# Altium project John_Main.PrjPcb (part 2 of 3)

## Sheet Controller Section.SchDoc
size A3; DocumentNumber: 6; SheetNumber: 6; SheetTotal: 7
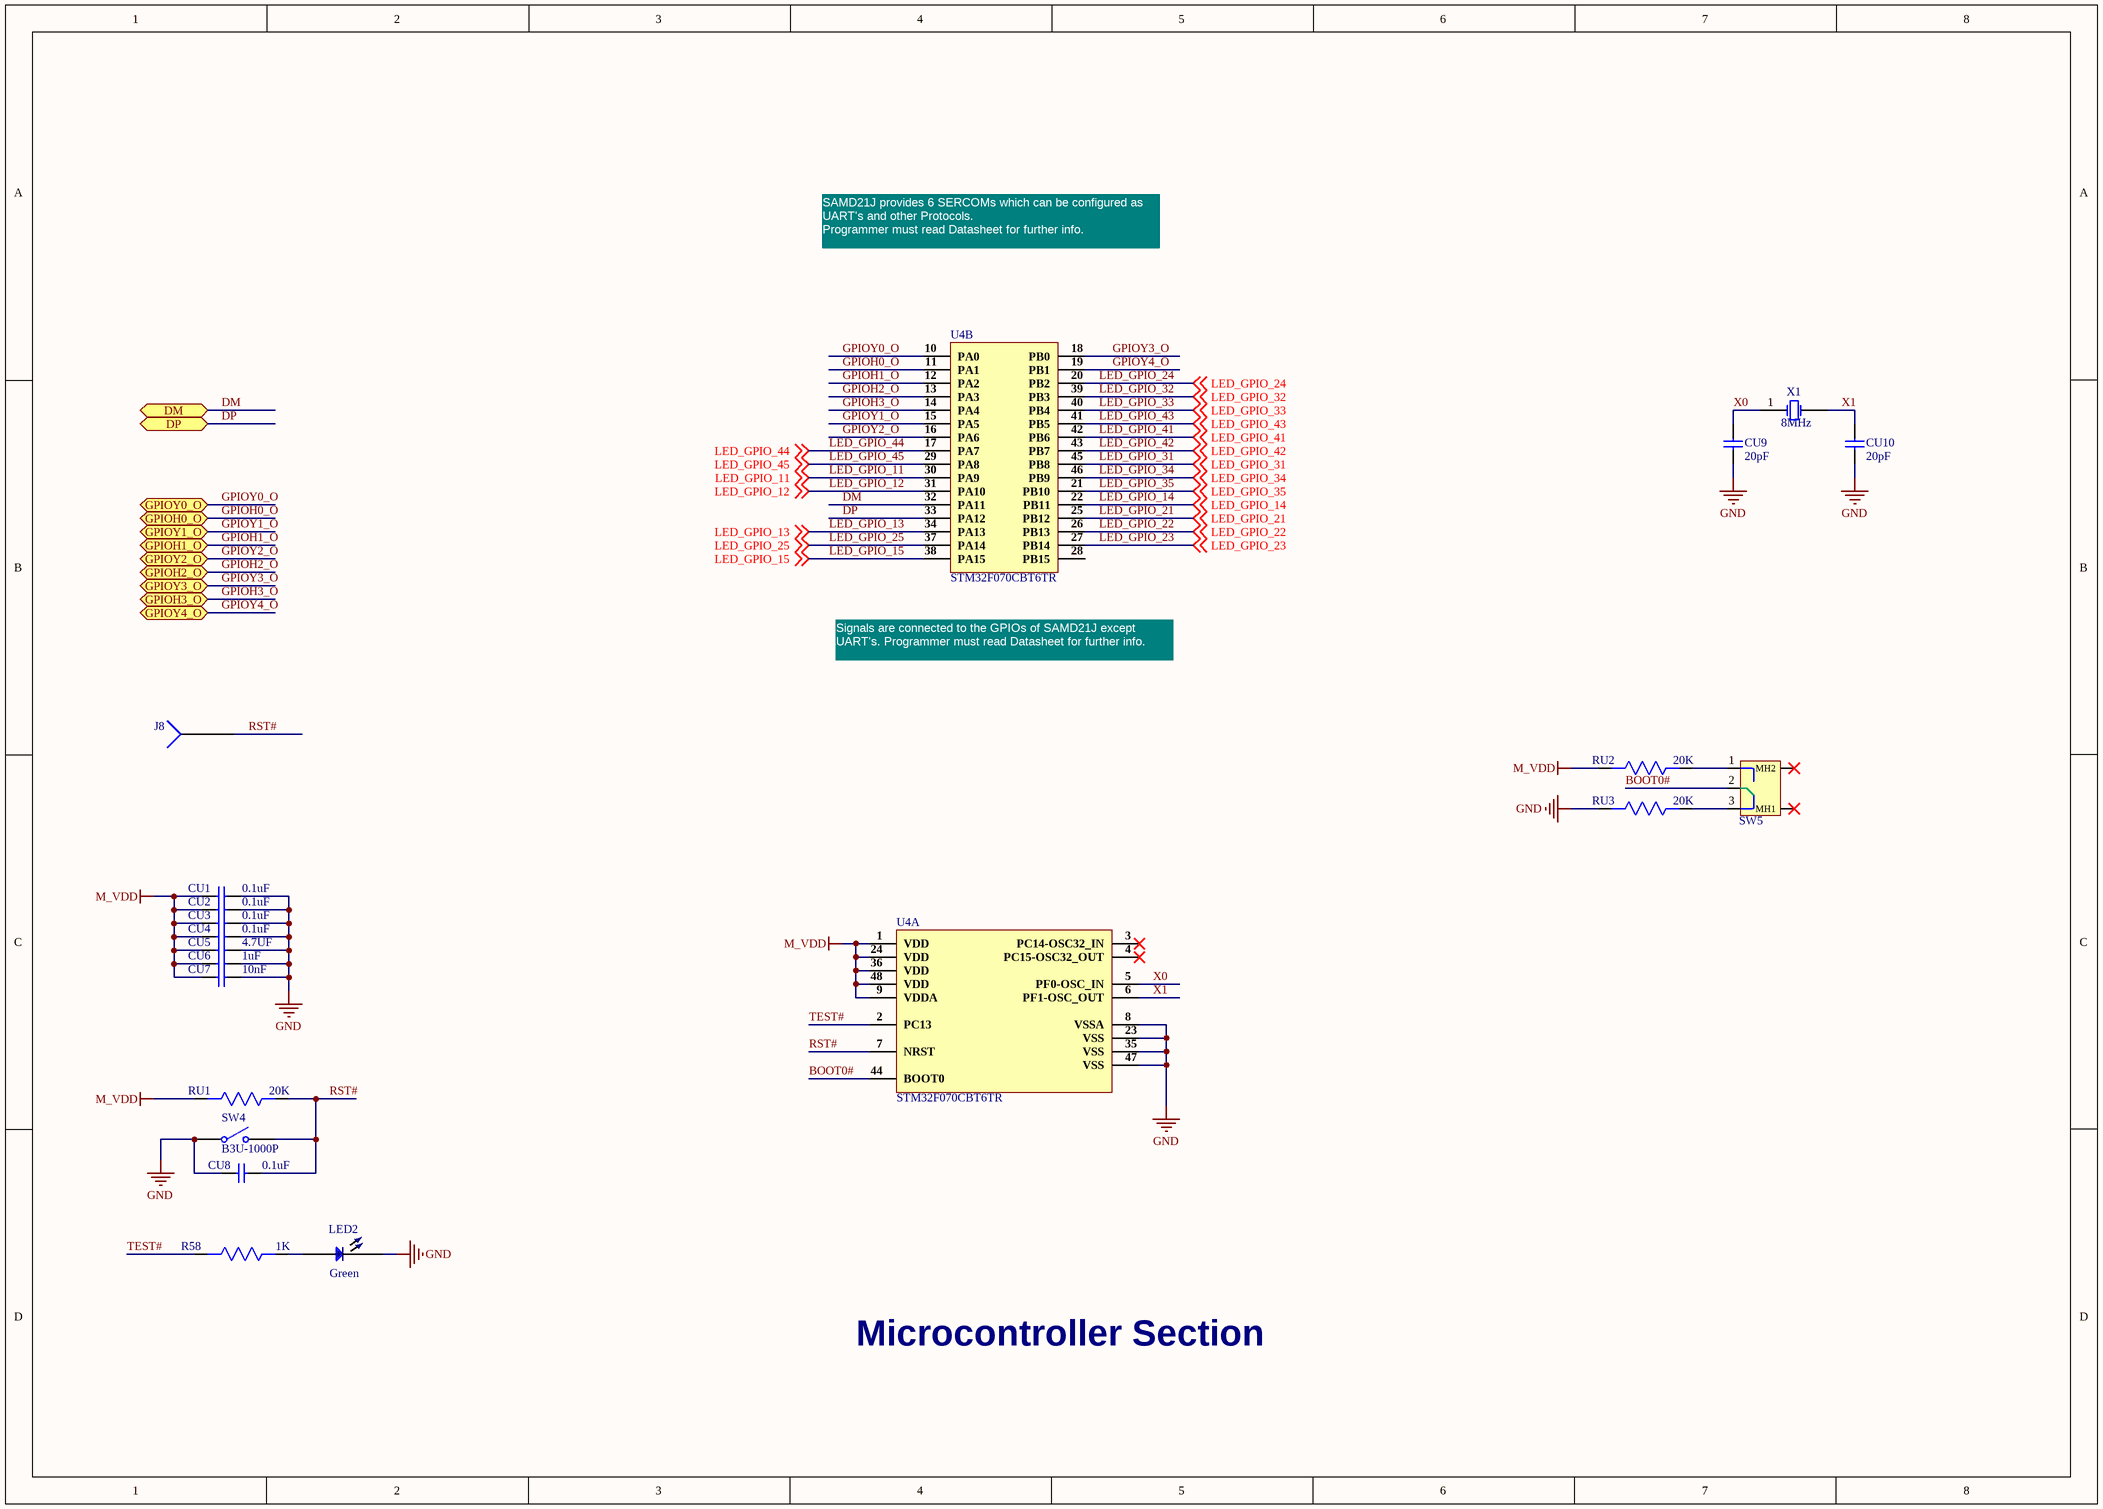
[diagram p2: Controller Section.SchDoc]

### Parts
CU1  0.1uF  [Cap0402]
CU2  0.1uF  [Cap0402]
CU3  0.1uF  [Cap0402]
CU4  0.1uF  [Cap0402]
CU5  4.7UF  [Cap0603]
CU6  1uF  [Cap0402]
CU7  10nF  [Cap0402]
CU8  0.1uF  [Cap0402]
CU9  20pF  [Cap 0201]
CU10  20pF  [Cap 0201]
J8  Socket  [Socket]  (value not drawn)
LED2  Color: Green  [LED SMT]  (hidden comment: LTST-C190KGKT)
R58  1K  [Res0402]
RU1  20K  [Res0402]
RU2  20K  [Res0402]
RU3  20K  [Res0402]
SW4  B3U-1000P  [B3U-1000P]
SW5  OS102011MA1QN1  [OS102011MA1QN1]  (value not drawn)
U4  STM32F070CBT6TR  [STM32F070CBT6TR]  (parts A,B of 2)
X1  value 8MHz  [49MD-8.000-20-20-20/A]  (hidden comment: 49MD-8.000-20-20-20/A)

### Ports
DM (bidir), DP (bidir), GPIOH0_O (bidir), GPIOH1_O (bidir), GPIOH2_O (bidir), GPIOH3_O (bidir), GPIOY0_O (bidir), GPIOY1_O (bidir), GPIOY2_O (bidir), GPIOY3_O (bidir), GPIOY4_O (bidir)

### Nets
GND: CU1.2 CU2.2 CU3.2 CU4.2 CU5.2 CU6.2 CU7.2 CU8.1 CU9.1 CU10.1 LED2.2 RU3.2 SW4.1 U4.8(VSSA) U4.23(VSS) U4.35(VSS) U4.47(VSS)
M_VDD: CU1.1 CU2.1 CU3.1 CU4.1 CU5.1 CU6.1 CU7.1 RU1.2 RU2.2 U4.1(VDD) U4.9(VDDA) U4.24(VDD) U4.36(VDD) U4.48(VDD)
BOOT0#: SW5.2(+) U4.44(BOOT0)
DM: U4.32(PA11) ; port DM
DP: U4.33(PA12) ; port DP
GPIOH0_O: U4.11(PA1) ; port GPIOH0_O
GPIOH1_O: U4.12(PA2) ; port GPIOH1_O
GPIOH2_O: U4.13(PA3) ; port GPIOH2_O
GPIOH3_O: U4.14(PA4) ; port GPIOH3_O
GPIOY0_O: U4.10(PA0) ; port GPIOY0_O
GPIOY1_O: U4.15(PA5) ; port GPIOY1_O
GPIOY2_O: U4.16(PA6) ; port GPIOY2_O
GPIOY3_O: U4.18(PB0) ; port GPIOY3_O
GPIOY4_O: U4.19(PB1) ; port GPIOY4_O
LED_GPIO_11: U4.30(PA9) ; off-sheet LED_GPIO_11
LED_GPIO_12: U4.31(PA10) ; off-sheet LED_GPIO_12
LED_GPIO_13: U4.34(PA13) ; off-sheet LED_GPIO_13
LED_GPIO_14: U4.22(PB11) ; off-sheet LED_GPIO_14
LED_GPIO_15: U4.38(PA15) ; off-sheet LED_GPIO_15
LED_GPIO_21: U4.25(PB12) ; off-sheet LED_GPIO_21
LED_GPIO_22: U4.26(PB13) ; off-sheet LED_GPIO_22
LED_GPIO_23: U4.27(PB14) ; off-sheet LED_GPIO_23
LED_GPIO_24: U4.20(PB2) ; off-sheet LED_GPIO_24
LED_GPIO_25: U4.37(PA14) ; off-sheet LED_GPIO_25
LED_GPIO_31: U4.45(PB8) ; off-sheet LED_GPIO_31
LED_GPIO_32: U4.39(PB3) ; off-sheet LED_GPIO_32
LED_GPIO_33: U4.40(PB4) ; off-sheet LED_GPIO_33
LED_GPIO_34: U4.46(PB9) ; off-sheet LED_GPIO_34
LED_GPIO_35: U4.21(PB10) ; off-sheet LED_GPIO_35
LED_GPIO_41: U4.42(PB6) ; off-sheet LED_GPIO_41
LED_GPIO_42: U4.43(PB7) ; off-sheet LED_GPIO_42
LED_GPIO_43: U4.41(PB5) ; off-sheet LED_GPIO_43
LED_GPIO_44: U4.17(PA7) ; off-sheet LED_GPIO_44
LED_GPIO_45: U4.29(PA8) ; off-sheet LED_GPIO_45
RST#: CU8.2 J8.1 RU1.1 SW4.2 U4.7(NRST)
TEST#: R58.1 U4.2(PC13)
X0: CU9.2 U4.5(PF0-OSC_IN) X1.1(OSC1)
X1: CU10.2 U4.6(PF1-OSC_OUT) X1.2(OSC2)
NetLED2_1: LED2.1 R58.2
NetRU2_1: RU2.1 SW5.1(+)
NetRU3_1: RU3.1 SW5.3(+)

Not connected (* = marked no-connect by the designer): SW5 MH1* MH2*; U4 3(PC14-OSC32_IN)* 4(PC15-OSC32_OUT)* 28(PB15)

### Notes on the sheet
- SAMD21J provides 6 SERCOMs which can be configured as UART's and other Protocols.
  Programmer must read Datasheet for further info.
- Signals are connected to the GPIOs of SAMD21J except UART's. Programmer must read Datasheet for further info.
- Microcontroller Section

### Library data of the parts
CU1-CU4 CU8 = CC0402KRX7R7BB104: CAP CER 0.1UF 16V X7R 0402; Manufacturer: Yageo; Tolerance: 10%; Capacitance: 100nF; Supplier 1: Digi-Key; Manufacturer Part Number: CC0402KRX7R7BB104; Stock 1: 16982736; Pricing 1: 1=0.1, 10=0.034, 100=0.015, 500=0.0107, 1000=0.00841, 2500=0.00764, 5000=0.00703 (USD); Mount: Surface Mount; Case/Package: 0402; Number of Pins: 2; Case Code (Metric): 1005; Case Code (Imperial): 0402; Min Operating Temperature: -55°C; Max Operating Temperature: 125°C; Dielectric: X7R; Voltage Rating: 16V; Voltage Rating (DC): 16V; Packaging: Tape and Reel; Package Quantity: 1; Termination: SMD/SMT; Composition: Ceramic; Voltage: 16V; Length: 1mm; Height: 0.5mm; Width: 0.02inch; Thickness: 0.022inch; Depth: 0.5mm; Radiation Hardening: No; REACH SVHC: No SVHC; Lead Free: Lead Free; Halogen Free: Halogen Free; ComponentLink1URL: http://www.yageo.com/documents/recent/UPY-GPHC_X7R_6.3V-to-50V_8.pdf?src-supplier=Avnet+Europe; ComponentLink1Description: http://www.yageo.com/documents/recent/UPY-GPHC_X7R_6.3V-to-50V_8.pdf?src-supplier=Avnet+Europe; ComponentLink2URL: http://www.yageo.com/documents/recent/UPY-GPHC_X7R_6.3V-to-50V_18.pdf?src-supplier=Digi-Key; ComponentLink2Description: http://www.yageo.com/documents/recent/UPY-GPHC_X7R_6.3V-to-50V_18.pdf?src-supplier=Digi-Key; ComponentLink3URL: http://www.yageo.com/documents/recent/UPY-GPHC_X7R_6.3V-to-50V_8.pdf?src-supplier=Avnet; ComponentLink3Description: http://www.yageo.com/documents/recent/UPY-GPHC_X7R_6.3V-to-50V_8.pdf?src-supplier=Avnet; ComponentLink4URL: http://www.yageo.com/documents/recent/UPY-GPHC_X7R_6.3V-to-50V_18.pdf?src-supplier=Mouser; ComponentLink4Description: http://www.yageo.com/documents/recent/UPY-GPHC_X7R_6.3V-to-50V_18.pdf?src-supplier=Mouser; ComponentLink5URL: http://www.farnell.com/datasheets/2167236.pdf?src-supplier=Element14; ComponentLink5Description: http://www.farnell.com/datasheets/2167236.pdf?src-supplier=Element14; ComponentLink6URL: http://www.farnell.com/datasheets/1489800.pdf?src-supplier=Element14; ComponentLink6Description: http://www.farnell.com/datasheets/1489800.pdf?src-supplier=Element14; Supplier Part Number 1: 311-1338-1-ND
CU5 = CL10A475KA8NQNC: CAP CER 4.7UF 25V X5R 0603; Manufacturer: Samsung; Tolerance: 10%; Supplier 1: Digi-Key; Manufacturer Part Number: CL10A475KA8NQNC; Stock 1: 2252340; Pricing 1: 1=0.37, 10=0.255, 100=0.1528, 500=0.11456, 1000=0.09675 (USD); Mount: Surface Mount; Case/Package: 0603; Case Code (Metric): 1608; Case Code (Imperial): 0603; Contact Plating: Tin; Min Operating Temperature: -55°C; Max Operating Temperature: 85°C; Package Quantity: 1; Packaging: Tape and Reel; Capacitance: 4.7uF; Voltage Rating: 25V; Dielectric: X5R; Termination: Wraparound; Length: 1.6mm; Width: 0.031inch; Thickness: 0.035inch; Depth: 0.8mm; Lead Free: Lead Free; ComponentLink1URL: http://www.samsungsem.com/kr/support/product-search/mlcc/CL10A475KA8NQNC.jsp?src-supplier=Digi-Key; ComponentLink1Description: http://www.samsungsem.com/kr/support/product-search/mlcc/CL10A475KA8NQNC.jsp?src-supplier=Digi-Key; Supplier Part Number 1: 1276-1900-1-ND
CU6 = GRM155R61E105KA12D: CAP CER 1UF 25V X5R 0402; Manufacturer: Murata; Tolerance: 10%; Supplier 1: Digi-Key; Manufacturer Part Number: GRM155R61E105KA12D; Stock 1: 1194305; Pricing 1: 1=0.11, 10=0.077, 100=0.0363, 500=0.02546, 1000=0.02108, 2500=0.01962, 5000=0.01795 (USD); Mount: Surface Mount; Case/Package: 0402; Weight: 0.000212oz; Case Code (Metric): 1005; Case Code (Imperial): 0402; Material: Ceramic; Min Operating Temperature: -55°C; Max Operating Temperature: 85°C; Capacitance: 1uF; Voltage Rating: 25V; Packaging: Tape and Reel; Dielectric: X5R; Voltage: 25V; Termination: SMD/SMT; Voltage Rating (DC): 25V; Package Quantity: 10000; Length: 1mm; Height: 0.5mm; Width: 0.5mm; Thickness: 0.022inch; Depth: 0.5mm; REACH SVHC: No SVHC; Lead Free: Lead Free; ComponentLink1URL: http://www.farnell.com/datasheets/2048341.pdf?src-supplier=Element14; ComponentLink1Description: http://www.farnell.com/datasheets/2048341.pdf?src-supplier=Element14; Supplier Part Number 1: 490-10017-1-ND
CU7 = CC0402KRX7R8BB103: CAP CER 10000PF 25V X7R 0402; Manufacturer: Yageo; Tolerance: 10%; Supplier 1: Digi-Key; Manufacturer Part Number: CC0402KRX7R8BB103; Stock 1: 0; Pricing 1: 1=0.1, 10=0.021, 100=0.0093, 500=0.00666, 1000=0.00523, 2500=0.00476, 5000=0.00438 (USD); Mount: Surface Mount; Case/Package: 0402; Case Code (Metric): 1005; Case Code (Imperial): 0402; Min Operating Temperature: -55°C; Max Operating Temperature: 125°C; Capacitance: 10nF; Dielectric: X7R; Voltage Rating: 25V; Package Quantity: 1; Packaging: Tape and Reel; Voltage Rating (DC): 25V; Termination: SMD/SMT; Composition: Ceramic; Length: 1mm; Height: 0.5mm; Depth: 0.5mm; Width: 0.02inch; Thickness: 0.022inch; Radiation Hardening: No; REACH SVHC: Unknown; Lead Free: Lead Free; Halogen Free: Halogen Free; ComponentLink1URL: http://www.yageo.com/documents/recent/UPY-GPHC_X7R_6.3V-to-50V_18.pdf?src-supplier=Digi-Key; ComponentLink1Description: http://www.yageo.com/documents/recent/UPY-GPHC_X7R_6.3V-to-50V_18.pdf?src-supplier=Digi-Key; ComponentLink2URL: https://www.verical.com/server-webapp/html/getDatasheet?partID=375418&src-supplier=Verical; ComponentLink2Description: https://www.verical.com/server-webapp/html/getDatasheet?partID=375418&src-supplier=Verical; ComponentLink3URL: http://www.yageo.com/documents/recent/UPY-GPHC_X7R_6.3V-to-50V_8.pdf?src-supplier=Avnet; ComponentLink3Description: http://www.yageo.com/documents/recent/UPY-GPHC_X7R_6.3V-to-50V_8.pdf?src-supplier=Avnet; ComponentLink4URL: https://4donline.ihs.com/images/VipMasterIC/IC/YAGO/YAGO-S-A0003557223/YAGO-S-A0003557223-1.pdf?hkey=52A5661711E402568146F3353EA87419&src-supplier=Element14; ComponentLink4Description: https://4donline.ihs.com/images/VipMasterIC/IC/YAGO/YAGO-S-A0003557223/YAGO-S-A0003557223-1.pdf?hkey=52A5661711E402568146F3353EA87419&src-supplier=Element14; ComponentLink5URL: http://www.farnell.com/datasheets/2167236.pdf?src-supplier=Element14; ComponentLink5Description: http://www.farnell.com/datasheets/2167236.pdf?src-supplier=Element14; ComponentLink6URL: http://www.mouser.com/ds/2/447/Yageo_UPY-GP_NP0_16V-to-50V_9-358835.pdf?src-supplier=Mouser; ComponentLink6Description: http://www.mouser.com/ds/2/447/Yageo_UPY-GP_NP0_16V-to-50V_9-358835.pdf?src-supplier=Mouser; Supplier Part Number 1: 311-1337-1-ND
CU9 CU10 = GJM0336C1E200JB01D: CAP CER 20PF 25V C0H 0201; Manufacturer: Murata; Tolerance: 5%; Supplier 1: Digi-Key; Manufacturer Part Number: GJM0336C1E200JB01D; Stock 1: 13650; Pricing 1: 1=0.1, 10=0.074, 100=0.0329, 500=0.02348, 1000=0.01845, 2500=0.01678, 5000=0.01543 (USD); Mount: Surface Mount; Case/Package: 0201; Case Code (Metric): 0603; Case Code (Imperial): 0201; Min Operating Temperature: -55°C; Max Operating Temperature: 125°C; Capacitance: 20pF; Voltage Rating: 25V; Packaging: Tape and Reel; Termination: SMD/SMT; Voltage Rating (DC): 25V; Length: 0.024inch; Width: 0.012inch; Thickness: 0.013inch; Lead Free: Lead Free; ComponentLink1URL: http://www.mouser.com/ds/2/281/c02e-2905.pdf?src-supplier=Mouser; ComponentLink1Description: http://www.mouser.com/ds/2/281/c02e-2905.pdf?src-supplier=Mouser; ComponentLink2URL: http://search.murata.co.jp/Ceramy/image/img/A01X/partnumbering_e_01.pdf?src-supplier=Digi-Key; ComponentLink2Description: http://search.murata.co.jp/Ceramy/image/img/A01X/partnumbering_e_01.pdf?src-supplier=Digi-Key; Supplier Part Number 1: 490-13313-1-ND
LED2 = LTST-C190KGKT: LED GREEN CLEAR CHIP SMD; Manufacturer: Vishay Lite-On; Lens Color: Colorless; Lens Style: Diffused,Colorless,Rectangular,Clear; Forward Voltage: 2V; Luminous Intensity: 35mcd; Viewing Angle: 130°; Dominant Wavelength: 571nm; Test Current: 20mA; Wavelength: 574nm; Forward Current: 30mA; Power Rating: 75mW; Number of Elements: 1; Reverse Voltage: 5V; Supplier 1: Digi-Key; Manufacturer Part Number: LTST-C190KGKT; Stock 1: 1327387; Pricing 1: 1=0.26, 10=0.188, 25=0.138, 100=0.0987, 250=0.06712, 500=0.05922, 1000=0.04639 (USD); Mount: Surface Mount; Case/Package: 0603; Number of Pins: 2; Case Code (Metric): 1608; Case Code (Imperial): 0603; Min Operating Temperature: -55°C; Max Operating Temperature: 85°C; Packaging: Tape and Reel; Package Quantity: 1; Lens Transparency: Clear; Illumination Color: Green; Power Dissipation: 75mW; Number of LEDs: 1; Length: 1.6mm; Height: 0.8mm; Width: 0.8mm; Depth: 0.8mm; Radiation Hardening: No; Lead Free: Lead Free; ComponentLink1URL: https://www.verical.com/server-webapp/html/getDatasheet?partID=141494&src-supplier=Verical; ComponentLink1Description: https://www.verical.com/server-webapp/html/getDatasheet?partID=141494&src-supplier=Verical; ComponentLink2URL: http://optoelectronics.liteon.com/upload/download/DS22-2000-074/LTST-C190KGKT.PDF?src-supplier=Digi-Key; ComponentLink2Description: http://optoelectronics.liteon.com/upload/download/DS22-2000-074/LTST-C190KGKT.PDF?src-supplier=Digi-Key; ComponentLink3URL: http://www.mouser.com/ds/2/239/LTST-C190KGKT-1141861.pdf?src-supplier=Mouser; ComponentLink3Description: http://www.mouser.com/ds/2/239/LTST-C190KGKT-1141861.pdf?src-supplier=Mouser; ComponentLink4URL: http://uk.rs-online.com/webdocs/0dc0/0900766b80dc02a8.pdf?src-supplier=RSComponents; ComponentLink4Description: http://uk.rs-online.com/webdocs/0dc0/0900766b80dc02a8.pdf?src-supplier=RSComponents; Supplier Part Number 1: 160-1435-6-ND
R58 = RT0402FRE071KL: RES SMD 1K OHM 1% 1/16W 0402; Manufacturer: Yageo; Resistance: 1kR; Temperature Coefficient: 50ppm/°C; Power Rating: 62.5mW; Voltage Rating: 50V; Max Power Dissipation: 63mW; Supplier 1: Digi-Key; Manufacturer Part Number 1: RT0402FRE071KL; Stock 1: 228425; Pricing 1: 1=0.1, 10=0.072, 100=0.0277, 1000=0.0122, 2500=0.0105, 5000=0.0094 (USD); Case/Package: 0402; Contact Plating: Tin,Matte,Lead; Case Code (Metric): 1005; Case Code (Imperial): 0402; Min Operating Temperature: -55°C; Max Operating Temperature: 125°C; Tolerance: 1%; Composition: Thin Film; Package Quantity: 10000; Packaging: Tape and Reel; Number of Terminations: 2; Termination: SMD/SMT; Military Standard: Not; Voltage Rating (DC): 50V; Features: Moisture Resistant; Length: 1mm; Height: 0.014inch; Width: 0.02inch; Depth: 0.5mm; Radiation Hardening: No; Lead Free: Lead Free; ComponentLink1URL: http://www.mouser.com/ds/2/447/yageodocoutput-1125656.pdf?src-supplier=Mouser; ComponentLink1Description: http://www.mouser.com/ds/2/447/yageodocoutput-1125656.pdf?src-supplier=Mouser; ComponentLink2URL: http://www.yageo.com/documents/recent/PYu-RT_1-to-0.01_RoHS_L_9.pdf?src-supplier=Digi-Key; ComponentLink2Description: http://www.yageo.com/documents/recent/PYu-RT_1-to-0.01_RoHS_L_9.pdf?src-supplier=Digi-Key; Supplier Part Number 1: YAG1234CT-ND
RU1-RU3 = RC0402JR-0720KL: RES SMD 20K OHM 1% 1/16W 0402; Manufacturer: Yageo; Resistance: 20kR; Power Rating: 62.5mW; Tolerance: 5%; Voltage Rating: 50V; Temperature Coefficient: 100ppm/°C; Max Power Dissipation: 63mW; ComponentLink1URL: https://industrial.panasonic.com/cdbs/www-data/pdf/RDA0000/AOA0000C301.pdf?src-supplier=Future+Electronics; ComponentLink1Description: https://industrial.panasonic.com/cdbs/www-data/pdf/RDA0000/AOA0000C301.pdf?src-supplier=Future+Electronics; ComponentLink2URL: http://www.jameco.com/Jameco/Products/ProdDS/1986781.pdf?src-supplier=Jameco; ComponentLink2Description: http://www.jameco.com/Jameco/Products/ProdDS/1986781.pdf?src-supplier=Jameco; ComponentLink3URL: http://www.farnell.com/datasheets/2059623.pdf?src-supplier=Farnell; ComponentLink3Description: http://www.farnell.com/datasheets/2059623.pdf?src-supplier=Farnell; ComponentLink4URL: http://industrial.panasonic.com/www-data/pdf/AOA0000/AOA0000CE1.pdf?src-supplier=Avnet; ComponentLink4Description: http://industrial.panasonic.com/www-data/pdf/AOA0000/AOA0000CE1.pdf?src-supplier=Avnet; ComponentLink5URL: http://www.alliedelec.com/m/d/51cd0790071e1666bdb9d00c57fcf960.pdf?src-supplier=Allied+Electronics; ComponentLink5Description: http://www.alliedelec.com/m/d/51cd0790071e1666bdb9d00c57fcf960.pdf?src-supplier=Allied+Electronics; ComponentLink6URL: http://industrial.panasonic.com/www-data/pdf/AOA0000/AOA0000CE1.pdf?src-supplier=Avnet+Europe; ComponentLink6Description: http://industrial.panasonic.com/www-data/pdf/AOA0000/AOA0000CE1.pdf?src-supplier=Avnet+Europe; ComponentLink7URL: http://www.farnell.com/datasheets/2059623.pdf?src-supplier=Element14; ComponentLink7Description: http://www.farnell.com/datasheets/2059623.pdf?src-supplier=Element14; ComponentLink8URL: http://industrial.panasonic.com/cdbs/www-data/pdf/RDA0000/AOA0000C301.pdf?src-supplier=Farnell; ComponentLink8Description: http://industrial.panasonic.com/cdbs/www-data/pdf/RDA0000/AOA0000C301.pdf?src-supplier=Farnell; ComponentLink9URL: http://industrial.panasonic.com/www-data/pdf/AOA0000/AOA0000CE1.pdf?src-supplier=Avnet+Asia; ComponentLink9Description: http://industrial.panasonic.com/www-data/pdf/AOA0000/AOA0000CE1.pdf?src-supplier=Avnet+Asia; ComponentLink10URL: http://www.yageo.com.tw/exep/pages/download/literatures/PYu-R_INT-thick_7.pdf?src-supplier=Digi-Key; ComponentLink10Description: http://www.yageo.com.tw/exep/pages/download/literatures/PYu-R_INT-thick_7.pdf?src-supplier=Digi-Key; ComponentLink11URL: http://www.yageo.com/NewPortal/yageodocoutput?fileName=/pdf/R-Chip/PYu-RC_51_RoHS_P_0.pdf&src-supplier=Digi-Key; ComponentLink11Description: http://www.yageo.com/NewPortal/yageodocoutput?fileName=/pdf/R-Chip/PYu-RC_51_RoHS_P_0.pdf&src-supplier=Digi-Key; ComponentLink12URL: http://www.yageo.com/documents/recent/PYu-RC0402_51_RoHS_L_6_r.pdf?src-supplier=Future+Electronics; ComponentLink12Description: http://www.yageo.com/documents/recent/PYu-RC0402_51_RoHS_L_6_r.pdf?src-supplier=Future+Electronics; ComponentLink13URL: http://www.mouser.com/ds/2/447/PYu-RC0402_51_RoHS_L_6_r-8721.pdf?src-supplier=Mouser; ComponentLink13Description: http://www.mouser.com/ds/2/447/PYu-RC0402_51_RoHS_L_6_r-8721.pdf?src-supplier=Mouser; ComponentLink14URL: http://www.yageo.com/documents/recent/PYu-RC0402_51_RoHS_L_6.pdf?src-supplier=Avnet+Europe; ComponentLink14Description: http://www.yageo.com/documents/recent/PYu-RC0402_51_RoHS_L_6.pdf?src-supplier=Avnet+Europe; Supplier 1: Digi-Key; Manufacturer Part Number: RC0402JR-0720KL; Stock 1: 4805429; Pricing 1: 1=0.1, 10=0.013, 100=0.0053, 1000=0.0024, 2500=0.0021, 5000=0.0017 (USD); Case/Package: 0402; Number of Pins: 2; Case Code (Metric): 1005; Case Code (Imperial): 0402; Min Operating Temperature: -55°C; Max Operating Temperature: 155°C; Package Quantity: 1; Packaging: Tape and Reel; Composition: Thick Film; Number of Terminations: 2; Termination: SMD/SMT; Military Standard: Not; Voltage Rating (DC): 50V; Features: Moisture Resistant; Length: 0.039inch; Height: 0.016inch; Width: 0.02inch; Depth: 0.5mm; REACH SVHC: No SVHC; Lead Free: Lead Free; ComponentLink15URL: http://www.yageo.com/documents/recent/PYu-RC_Group_51_RoHS_L_9.pdf?src-supplier=Digi-Key; ComponentLink15Description: http://www.yageo.com/documents/recent/PYu-RC_Group_51_RoHS_L_9.pdf?src-supplier=Digi-Key; ComponentLink16URL: http://www.farnell.com/datasheets/1018594.pdf?src-supplier=Element14; ComponentLink16Description: http://www.farnell.com/datasheets/1018594.pdf?src-supplier=Element14; Supplier Part Number 1: 311-20KJRCT-ND
SW4 = B3U-1000P: SWITCH TACTILE SPST-NO 0.05A 12V; Manufacturer: Omron; Mechanical Life: 200000Cycles; Operating Force: 1.5N; Throw Configuration: SPST; Current Rating: 50mA; Contact Resistance: 100mR; Illumination Type: Non-Illuminated,Illuminated; Switch Travel: 0.15mm; Switch Function: Off-Mom; Actuator Type: Standard; Actuator Length: 0.4mm; Ratings: Dust Proof,IP40; ComponentLink1URL: http://www.farnell.com/datasheets/60838.pdf?src-supplier=Farnell; ComponentLink1Description: http://www.farnell.com/datasheets/60838.pdf?src-supplier=Farnell; ComponentLink2URL: http://www.farnell.com/datasheets/60838.pdf?src-supplier=Element14; ComponentLink2Description: http://www.farnell.com/datasheets/60838.pdf?src-supplier=Element14; ComponentLink3URL: https://omronfs.omron.com/en_US/ecb/products/pdf/en-b3u.pdf?src-supplier=Digi-Key; ComponentLink3Description: https://omronfs.omron.com/en_US/ecb/products/pdf/en-b3u.pdf?src-supplier=Digi-Key; ComponentLink4URL: http://www.omron.com/ecb/products/pdf/en-b3u.pdf?src-supplier=Digi-Key; ComponentLink4Description: http://www.omron.com/ecb/products/pdf/en-b3u.pdf?src-supplier=Digi-Key; ComponentLink5URL: https://www.distrelec.biz/Web/Downloads/he/et/B3U_eng_datasheet.pdf?mime=application%2Fpdf&src-supplier=Distrelec; ComponentLink5Description: https://www.distrelec.biz/Web/Downloads/he/et/B3U_eng_datasheet.pdf?mime=application%2Fpdf&src-supplier=Distrelec; ComponentLink6URL: http://www.onlinecomponents.com/productFiles/mf-OM/en-b3u.pdf?src-supplier=Onlinecomponents.com; ComponentLink6Description: http://www.onlinecomponents.com/productFiles/mf-OM/en-b3u.pdf?src-supplier=Onlinecomponents.com; Supplier 1: Digi-Key; Manufacturer Part Number: B3U-1000P; Stock 1: 116454; Pricing 1: 1=1, 10=0.961, 25=0.9064, 50=0.7976, 100=0.7251, 250=0.68888, 500=0.67074, 1000=0.52571 (USD); Mount: Surface Mount; Weight: 0.000776oz; Contact Material: Silver; Min Operating Temperature: -25°C; Max Operating Temperature: 70°C; Packaging: Tape and Reel; Voltage Rating (DC): 12V; Package Quantity: 1; Max Current Rating: 50mA; Termination: SMD/SMT; Orientation: Straight; Max Voltage Rating (DC): 12V; Electrical Life: 200000Cycles; Insulation Resistance: 100MR; Contact Current Rating: 50mA; Length: 4mm; Height: 1.2mm; Depth: 2.5mm; Width: 3mm; REACH SVHC: Unknown; Lead Free: Lead Free; ComponentLink7URL: https://www.verical.com/server-webapp/html/getDatasheet?partID=552554&src-supplier=Verical; ComponentLink7Description: https://www.verical.com/server-webapp/html/getDatasheet?partID=552554&src-supplier=Verical; ComponentLink8URL: http://www.farnell.com/datasheets/1685550.pdf?src-supplier=Element14; ComponentLink8Description: http://www.farnell.com/datasheets/1685550.pdf?src-supplier=Element14; ComponentLink9URL: http://www.farnell.com/datasheets/2610940.pdf?src-supplier=Farnell; ComponentLink9Description: http://www.farnell.com/datasheets/2610940.pdf?src-supplier=Farnell; ComponentLink10URL: https://www.alliedelec.com/m/d/4c8a9ef82804fc3c241a13c1e298fd73.pdf?src-supplier=Allied+Electronics; ComponentLink10Description: https://www.alliedelec.com/m/d/4c8a9ef82804fc3c241a13c1e298fd73.pdf?src-supplier=Allied+Electronics; Supplier Part Number 1: SW1020DKR-ND
SW5 = OS102011MA1QN1: 2 Position SPDT Miniature Slide Switch 100MA 12V Through Hole, Right Angle; Manufacturer: ITT C&K; Mechanical Life: 10000Cycles; Body Material: Tin; Actuator Material: Polyoxymethylene,Acetal,Polyacetal; Contact Resistance: 20mR; Contact Style: Non-Shorting; Insulation Resistance: 100MR; Switch Travel: 2mm; Switch Function: On-On; Actuator Type: Standard; Actuator Length: 4mm; Supplier 1: Digi-Key; Manufacturer Part Number: OS102011MA1QN1; Stock 1: 24069; Pricing 1: 1=0.38, 10=0.363, 25=0.3552, 50=0.3176, 100=0.3024, 250=0.2948, 500=0.2495, 1000=0.2419, 5000=0.2117 (USD); Mount: Through Hole,Brackets,PCB; Contact Material: Copper Alloy,Brass,Silver; Contact Plating: Silver,Gold; Housing Material: Resin; Min Operating Temperature: -10°C; Max Operating Temperature: 70°C; Packaging: Bulk; Throw Configuration: SPDT; Voltage Rating (DC): 12V; Max Current Rating: 100mA; Contact Current Rating: 100mA; Max Voltage Rating (DC): 12V; Package Quantity: 300; Current Rating: 100mA; Termination: PC Pins; Electrical Life: 10000Cycles; Orientation: Right Angle; Length: 8.6mm; Width: 4.4mm; Depth: 8.4mm; Radiation Hardening: No; REACH SVHC: No SVHC; Lead Free: Lead Free; ComponentLink1URL: http://www.jameco.com/Jameco/Products/ProdDS/588220.pdf?src-supplier=Jameco; ComponentLink1Description: http://www.jameco.com/Jameco/Products/ProdDS/588220.pdf?src-supplier=Jameco; ComponentLink2URL: http://uk.rs-online.com/webdocs/1263/0900766b81263f61.pdf?src-supplier=RSComponents; ComponentLink2Description: http://uk.rs-online.com/webdocs/1263/0900766b81263f61.pdf?src-supplier=RSComponents; ComponentLink3URL: http://www.farnell.com/datasheets/1683358.pdf?src-supplier=Element14; ComponentLink3Description: http://www.farnell.com/datasheets/1683358.pdf?src-supplier=Element14; ComponentLink4URL: http://www1.futureelectronics.com/doc/C%20-%20K%20COMPONENTS/OS102011MA1QN1.pdf?src-supplier=Future+Electronics; ComponentLink4Description: http://www1.futureelectronics.com/doc/C%20-%20K%20COMPONENTS/OS102011MA1QN1.pdf?src-supplier=Future+Electronics; ComponentLink5URL: https://www.ckswitches.com/media/1428/os.pdf?src-supplier=Digi-Key; ComponentLink5Description: https://www.ckswitches.com/media/1428/os.pdf?src-supplier=Digi-Key; ComponentLink6URL: https://www.alliedelec.com/m/d/08271ccc8b1809c6b911a7d3c93f3e8a.pdf?src-supplier=Allied+Electronics; ComponentLink6Description: https://www.alliedelec.com/m/d/08271ccc8b1809c6b911a7d3c93f3e8a.pdf?src-supplier=Allied+Electronics; ComponentLink7URL: http://www.farnell.com/datasheets/2674787.pdf?src-supplier=Newark; ComponentLink7Description: http://www.farnell.com/datasheets/2674787.pdf?src-supplier=Newark; Supplier Part Number 1: CKN9559-ND
U4 = STM32F070CBT6TR: IC MCU 32BIT 128KB FLASH 48LQFP
X1 = 49MD-8.000-20-20-20/A: 8MHz ±20ppm 20pF SMD,12.5x4.5mm SMD Crystal Resonators RoHS; Manufacturer: Suzhou Liming Elec; Manufacturer Part No: 49MD-8.000-20-20-20/A; Package: Custom
J8 = Socket: LatestRevisionDate: 17-Jul-2002; LatestRevisionNote: Re-released for DXP Platform.; Publisher: Altium Limited

## Sheet LED's Section_1.SchDoc
size A3; DocumentNumber: 4; SheetNumber: 4; SheetTotal: 7
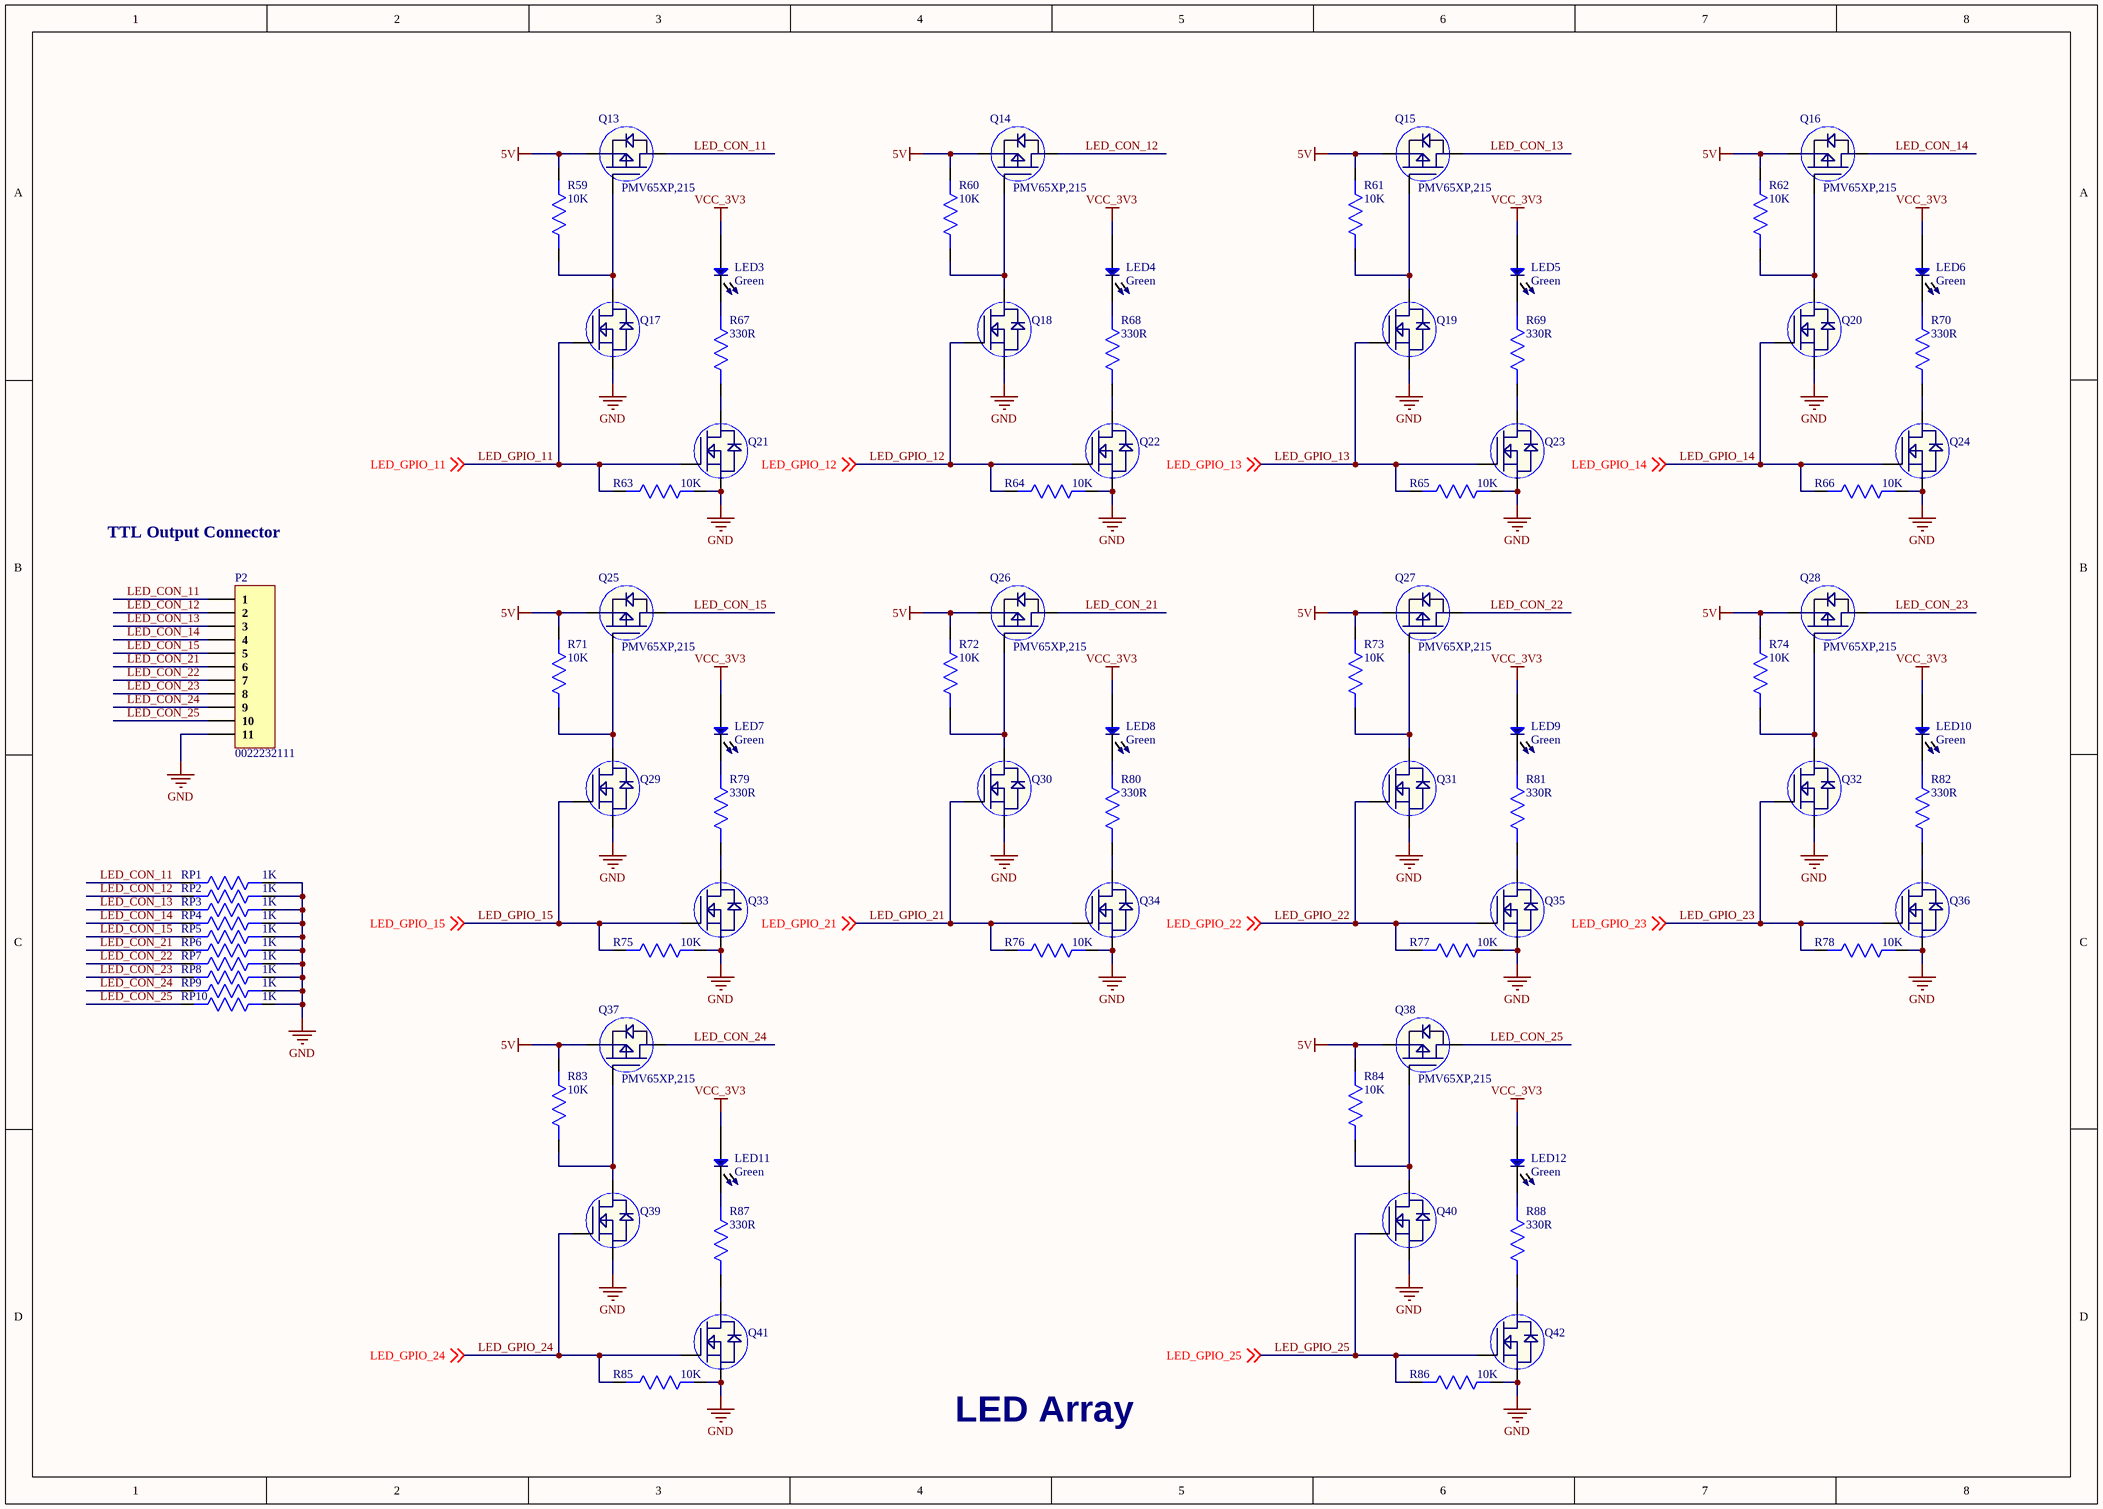
[diagram p3: LED's Section_1.SchDoc]

### Parts
LED3  Color: Green  [LED SMT]  (hidden comment: LTST-C190KGKT)
LED4  Color: Green  [LED SMT]  (hidden comment: LTST-C190KGKT)
LED5  Color: Green  [LED SMT]  (hidden comment: LTST-C190KGKT)
LED6  Color: Green  [LED SMT]  (hidden comment: LTST-C190KGKT)
LED7  Color: Green  [LED SMT]  (hidden comment: LTST-C190KGKT)
LED8  Color: Green  [LED SMT]  (hidden comment: LTST-C190KGKT)
LED9  Color: Green  [LED SMT]  (hidden comment: LTST-C190KGKT)
LED10  Color: Green  [LED SMT]  (hidden comment: LTST-C190KGKT)
LED11  Color: Green  [LED SMT]  (hidden comment: LTST-C190KGKT)
LED12  Color: Green  [LED SMT]  (hidden comment: LTST-C190KGKT)
P2  0022232111  [0022232111]
Q13  PMV65XP,215  [SOT23-3]
Q14  PMV65XP,215  [SOT23-3]
Q15  PMV65XP,215  [SOT23-3]
Q16  PMV65XP,215  [SOT23-3]
Q17  BSS138LT1G  [SOT23-3]  (value not drawn)
Q18  BSS138LT1G  [SOT23-3]  (value not drawn)
Q19  BSS138LT1G  [SOT23-3]  (value not drawn)
Q20  BSS138LT1G  [SOT23-3]  (value not drawn)
Q21  BSS138LT1G  [SOT23-3]  (value not drawn)
Q22  BSS138LT1G  [SOT23-3]  (value not drawn)
Q23  BSS138LT1G  [SOT23-3]  (value not drawn)
Q24  BSS138LT1G  [SOT23-3]  (value not drawn)
Q25  PMV65XP,215  [SOT23-3]
Q26  PMV65XP,215  [SOT23-3]
Q27  PMV65XP,215  [SOT23-3]
Q28  PMV65XP,215  [SOT23-3]
Q29  BSS138LT1G  [SOT23-3]  (value not drawn)
Q30  BSS138LT1G  [SOT23-3]  (value not drawn)
Q31  BSS138LT1G  [SOT23-3]  (value not drawn)
Q32  BSS138LT1G  [SOT23-3]  (value not drawn)
Q33  BSS138LT1G  [SOT23-3]  (value not drawn)
Q34  BSS138LT1G  [SOT23-3]  (value not drawn)
Q35  BSS138LT1G  [SOT23-3]  (value not drawn)
Q36  BSS138LT1G  [SOT23-3]  (value not drawn)
Q37  PMV65XP,215  [SOT23-3]
Q38  PMV65XP,215  [SOT23-3]
Q39  BSS138LT1G  [SOT23-3]  (value not drawn)
Q40  BSS138LT1G  [SOT23-3]  (value not drawn)
Q41  BSS138LT1G  [SOT23-3]  (value not drawn)
Q42  BSS138LT1G  [SOT23-3]  (value not drawn)
R59  10K  [Res0402]
R60  10K  [Res0402]
R61  10K  [Res0402]
R62  10K  [Res0402]
R63  10K  [Res0402]
R64  10K  [Res0402]
R65  10K  [Res0402]
R66  10K  [Res0402]
R67  330R  [Res0402]
R68  330R  [Res0402]
R69  330R  [Res0402]
R70  330R  [Res0402]
R71  10K  [Res0402]
R72  10K  [Res0402]
R73  10K  [Res0402]
R74  10K  [Res0402]
R75  10K  [Res0402]
R76  10K  [Res0402]
R77  10K  [Res0402]
R78  10K  [Res0402]
R79  330R  [Res0402]
R80  330R  [Res0402]
R81  330R  [Res0402]
R82  330R  [Res0402]
R83  10K  [Res0402]
R84  10K  [Res0402]
R85  10K  [Res0402]
R86  10K  [Res0402]
R87  330R  [Res0402]
R88  330R  [Res0402]
RP1  1K  [Res0402]
RP2  1K  [Res0402]
RP3  1K  [Res0402]
RP4  1K  [Res0402]
RP5  1K  [Res0402]
RP6  1K  [Res0402]
RP7  1K  [Res0402]
RP8  1K  [Res0402]
RP9  1K  [Res0402]
RP10  1K  [Res0402]

### Nets
5V: Q13.2(S) Q14.2(S) Q15.2(S) Q16.2(S) Q25.2(S) Q26.2(S) Q27.2(S) Q28.2(S) Q37.2(S) Q38.2(S) R59.2 R60.2 R61.2 R62.2 R71.2 R72.2 R73.2 R74.2 R83.2 R84.2
GND: P2.11 Q17.2(S) Q18.2(S) Q19.2(S) Q20.2(S) Q21.2(S) Q22.2(S) Q23.2(S) Q24.2(S) Q29.2(S) Q30.2(S) Q31.2(S) Q32.2(S) Q33.2(S) Q34.2(S) Q35.2(S) Q36.2(S) Q39.2(S) Q40.2(S) Q41.2(S) Q42.2(S) R63.2 R64.2 R65.2 R66.2 R75.2 R76.2 R77.2 R78.2 R85.2 R86.2 RP1.1 RP2.1 RP3.1 RP4.1 RP5.1 RP6.1 RP7.1 RP8.1 RP9.1 RP10.1
VCC_3V3: LED3.1 LED4.1 LED5.1 LED6.1 LED7.1 LED8.1 LED9.1 LED10.1 LED11.1 LED12.1
LED_CON_11: P2.1 Q13.3(D) RP1.2
LED_CON_12: P2.2 Q14.3(D) RP2.2
LED_CON_13: P2.3 Q15.3(D) RP3.2
LED_CON_14: P2.4 Q16.3(D) RP4.2
LED_CON_15: P2.5 Q25.3(D) RP5.2
LED_CON_21: P2.6 Q26.3(D) RP6.2
LED_CON_22: P2.7 Q27.3(D) RP7.2
LED_CON_23: P2.8 Q28.3(D) RP8.2
LED_CON_24: P2.9 Q37.3(D) RP9.2
LED_CON_25: P2.10 Q38.3(D) RP10.2
LED_GPIO_11: Q17.1(G) Q21.1(G) R63.1 ; off-sheet LED_GPIO_11
LED_GPIO_12: Q18.1(G) Q22.1(G) R64.1 ; off-sheet LED_GPIO_12
LED_GPIO_13: Q19.1(G) Q23.1(G) R65.1 ; off-sheet LED_GPIO_13
LED_GPIO_14: Q20.1(G) Q24.1(G) R66.1 ; off-sheet LED_GPIO_14
LED_GPIO_15: Q29.1(G) Q33.1(G) R75.1 ; off-sheet LED_GPIO_15
LED_GPIO_21: Q30.1(G) Q34.1(G) R76.1 ; off-sheet LED_GPIO_21
LED_GPIO_22: Q31.1(G) Q35.1(G) R77.1 ; off-sheet LED_GPIO_22
LED_GPIO_23: Q32.1(G) Q36.1(G) R78.1 ; off-sheet LED_GPIO_23
LED_GPIO_24: Q39.1(G) Q41.1(G) R85.1 ; off-sheet LED_GPIO_24
LED_GPIO_25: Q40.1(G) Q42.1(G) R86.1 ; off-sheet LED_GPIO_25
NetLED3_2: LED3.2 R67.1
NetLED4_2: LED4.2 R68.1
NetLED5_2: LED5.2 R69.1
NetLED6_2: LED6.2 R70.1
NetLED7_2: LED7.2 R79.1
NetLED8_2: LED8.2 R80.1
NetLED9_2: LED9.2 R81.1
NetLED10_2: LED10.2 R82.1
NetLED11_2: LED11.2 R87.1
NetLED12_2: LED12.2 R88.1
NetQ13_1: Q13.1(G) Q17.3(D) R59.1
NetQ14_1: Q14.1(G) Q18.3(D) R60.1
NetQ15_1: Q15.1(G) Q19.3(D) R61.1
NetQ16_1: Q16.1(G) Q20.3(D) R62.1
NetQ21_3: Q21.3(D) R67.2
NetQ22_3: Q22.3(D) R68.2
NetQ23_3: Q23.3(D) R69.2
NetQ24_3: Q24.3(D) R70.2
NetQ25_1: Q25.1(G) Q29.3(D) R71.1
NetQ26_1: Q26.1(G) Q30.3(D) R72.1
NetQ27_1: Q27.1(G) Q31.3(D) R73.1
NetQ28_1: Q28.1(G) Q32.3(D) R74.1
NetQ33_3: Q33.3(D) R79.2
NetQ34_3: Q34.3(D) R80.2
NetQ35_3: Q35.3(D) R81.2
NetQ36_3: Q36.3(D) R82.2
NetQ37_1: Q37.1(G) Q39.3(D) R83.1
NetQ38_1: Q38.1(G) Q40.3(D) R84.1
NetQ41_3: Q41.3(D) R87.2
NetQ42_3: Q42.3(D) R88.2

### Notes on the sheet
- TTL Output Connector
- LED Array

### Library data of the parts
LED3-LED12 = LTST-C190KGKT: as LED2 on sheet Controller Section; Supplier 1: Digi-Key; Manufacturer Part Number: LTST-C190KGKT; Stock 1: 1327387; Pricing 1: 1=0.26, 10=0.188, 25=0.138, 100=0.0987, 250=0.06712, 500=0.05922, 1000=0.04639 (USD); Mount: Surface Mount; Case/Package: 0603; Number of Pins: 2; Case Code (Metric): 1608; Case Code (Imperial): 0603; Min Operating Temperature: -55°C; Max Operating Temperature: 85°C; Packaging: Tape and Reel; Package Quantity: 1; Lens Transparency: Clear; Illumination Color: Green; Power Dissipation: 75mW; Number of LEDs: 1; Length: 1.6mm; Height: 0.8mm; Width: 0.8mm; Depth: 0.8mm; Radiation Hardening: No; Lead Free: Lead Free; ComponentLink1URL: https://www.verical.com/server-webapp/html/getDatasheet?partID=141494&src-supplier=Verical; ComponentLink1Description: https://www.verical.com/server-webapp/html/getDatasheet?partID=141494&src-supplier=Verical; ComponentLink2URL: http://optoelectronics.liteon.com/upload/download/DS22-2000-074/LTST-C190KGKT.PDF?src-supplier=Digi-Key; ComponentLink2Description: http://optoelectronics.liteon.com/upload/download/DS22-2000-074/LTST-C190KGKT.PDF?src-supplier=Digi-Key; ComponentLink3URL: http://www.mouser.com/ds/2/239/LTST-C190KGKT-1141861.pdf?src-supplier=Mouser; ComponentLink3Description: http://www.mouser.com/ds/2/239/LTST-C190KGKT-1141861.pdf?src-supplier=Mouser; ComponentLink4URL: http://uk.rs-online.com/webdocs/0dc0/0900766b80dc02a8.pdf?src-supplier=RSComponents; ComponentLink4Description: http://uk.rs-online.com/webdocs/0dc0/0900766b80dc02a8.pdf?src-supplier=RSComponents; Supplier Part Number 1: 160-1435-6-ND
P2 = 0022232111: CONN HEADER VERT 11POS 2.54MM; Manufacturer: Molex; Contact Resistance: 10mR; Number of Contacts: 11; Gender: Male; Supplier 1: Digi-Key; Manufacturer Part Number: 0022232111; Stock 1: 1529; Pricing 1: 1=0.74, 10=0.652, 100=0.5628, 500=0.46046, 1000=0.4093, 5000=0.35813, 10000=0.34023 (USD); Contact Plating: Copper,Tin; Contact Material: Brass; Housing Color: White; Housing Material: Nylon; Min Operating Temperature: 0°C; Max Operating Temperature: 75°C; Number of Rows: 1; Packaging: Bag; Termination: Solder; Orientation: Straight; Length: 27.94mm; Pitch: 2.54mm; Depth: 6.35mm; ComponentLink1URL: http://components.arrow.com/part/dataview/4703620S3674830N3303?src-supplier=Arrow; ComponentLink1Description: http://components.arrow.com/part/dataview/4703620S3674830N3303?src-supplier=Arrow; Supplier Part Number 1: 23-0022232111-ND
Q13-Q16 Q25-Q28 Q37 Q38 = PMV65XP,215: MOSFET P-CH 20V 2.8A SOT-23; Manufacturer: Nexperia; Supplier 1: Digi-Key; Manufacturer Part Number: PMV65XP,215; Stock 1: 60287; Pricing 1: 1=0.38, 10=0.28, 25=0.2452, 100=0.133, 250=0.13232, 500=0.1085, 1000=0.0805 (USD); Supplier Part Number 1: 1727-3124-1-ND
Q17-Q24 Q29-Q36 Q39-Q42 = BSS138LT1G: MOSFET N-CH 50V 200MA SOT-23; Manufacturer: ON Semiconductor; Gate to Source Voltage (Vgs): 20V; Nominal Vgs: 1.5V; Rds On Max: 3.5R; Input Capacitance: 50pF; Number of Elements: 1; Max Power Dissipation: 225mW; Turn-Off Delay Time: 20ns; Element Configuration: Single; ComponentLink1URL: https://datasheet.ciiva.com/22641/1596366-22641636.pdf; ComponentLink1Description: https://datasheet.ciiva.com/22641/1596366-22641636.pdf; ComponentLink2URL: https://datasheet.ciiva.com/1190/1596366-1190137.pdf; ComponentLink2Description: https://datasheet.ciiva.com/1190/1596366-1190137.pdf; ComponentLink3URL: https://datasheet.ciiva.com/15198/getdatasheetpartid-110266-15198908.pdf; ComponentLink3Description: https://datasheet.ciiva.com/15198/getdatasheetpartid-110266-15198908.pdf; ComponentLink4URL: https://datasheet.ciiva.com/8115/bss138lt1-d-8115295.pdf; ComponentLink4Description: https://datasheet.ciiva.com/8115/bss138lt1-d-8115295.pdf; ComponentLink5URL: https://datasheet.ciiva.com/8115/bss138lt1-d-8115358.pdf; ComponentLink5Description: https://datasheet.ciiva.com/8115/bss138lt1-d-8115358.pdf; ComponentLink6URL: https://datasheet.ciiva.com/1190/1596366-1190136.pdf; ComponentLink6Description: https://datasheet.ciiva.com/1190/1596366-1190136.pdf; ComponentLink7URL: https://datasheet.ciiva.com/936/bss138lt1-d-936802.pdf; ComponentLink7Description: https://datasheet.ciiva.com/936/bss138lt1-d-936802.pdf; ComponentLink8URL: https://datasheet.ciiva.com/936/bss138lt1-d-936801.pdf; ComponentLink8Description: https://datasheet.ciiva.com/936/bss138lt1-d-936801.pdf; ComponentLink9URL: https://datasheet.ciiva.com/14553/70099493-14553829.pdf; ComponentLink9Description: https://datasheet.ciiva.com/14553/70099493-14553829.pdf; ComponentLink10URL: https://datasheet.ciiva.com/936/bss138lt1-d-936803.pdf; ComponentLink10Description: https://datasheet.ciiva.com/936/bss138lt1-d-936803.pdf; Supplier 1: Digi-Key; Manufacturer Part Number: BSS138LT1G; Stock 1: 1283212; Pricing 1: 1=0.27, 10=0.222, 100=0.1177, 500=0.07746, 1000=0.05267 (USD); Case/Package: SOT-23-3; Number of Pins: 3; Contact Plating: Tin,Matte; Min Operating Temperature: -55°C; Max Operating Temperature: 150°C; Continuous Drain Current (ID): 200mA; Package Quantity: 1; Packaging: Tape and Reel; Drain to Source Breakdown Voltage: 50V; Power Dissipation: 225mW; Drain to Source Resistance: 3.5R; Threshold Voltage: 1.5V; Turn-On Delay Time: 20ns; Voltage Rating (DC): 50V; Current Rating: 200mA; On-State Resistance: 3.5R; Length: 3.04mm; Height: 1.01mm; Width: 1.4mm; Radiation Hardening: No; REACH SVHC: No SVHC; Lead Free: Lead Free; Halogen Free: Halogen Free; ComponentLink11URL: http://www.onsemi.com/pub/Collateral/BSS138LT1-D.PDF?src-supplier=Digi-Key; ComponentLink11Description: http://www.onsemi.com/pub/Collateral/BSS138LT1-D.PDF?src-supplier=Digi-Key; ComponentLink12URL: http://www.farnell.com/datasheets/1596366.pdf?src-supplier=Element14; ComponentLink12Description: http://www.farnell.com/datasheets/1596366.pdf?src-supplier=Element14; ComponentLink13URL: http://www.alliedelec.com/m/d/b3c6fd7d92596813fe75d33dcbaaae90.pdf?src-supplier=Allied+Electronics; ComponentLink13Description: http://www.alliedelec.com/m/d/b3c6fd7d92596813fe75d33dcbaaae90.pdf?src-supplier=Allied+Electronics; ComponentLink14URL: https://www.verical.com/server-webapp/html/getDatasheet?partID=110266&src-supplier=Verical; ComponentLink14Description: https://www.verical.com/server-webapp/html/getDatasheet?partID=110266&src-supplier=Verical; ComponentLink15URL: http://www.onsemi.com/pub_link/Collateral/BSS138LT1-D.PDF?src-supplier=Avnet; ComponentLink15Description: http://www.onsemi.com/pub_link/Collateral/BSS138LT1-D.PDF?src-supplier=Avnet; Supplier Part Number 1: BSS138LT1GOSDKR-ND
R59-R66 R71-R78 R83-R86 = RC0402FR-0710KL: RES SMD 10K OHM 1% 1/16W 0402; Manufacturer: Yageo Phycomp; Temperature Coefficient: 100ppm/°C; Resistance: 10000R; Voltage Rating (DC): 50V; Power Rating: 63mW; Supplier 1: Digi-Key; Manufacturer Part Number: RC0402FR-0710KL; Stock 1: 98435877; Pricing 1: 1=0.1, 10=0.016, 100=0.0067, 1000=0.00301, 2500=0.00261, 5000=0.00215 (USD); Mount: Surface Mount; Case/Package: 0402; Number of Pins: 2; Min Operating Temperature: -55°C; Max Operating Temperature: 155°C; Tolerance: 1%; Packaging: Cut Tape; Length: 1mm; Height: 0.32mm; Width: 500um; Depth: 0.5mm; REACH SVHC: No SVHC; Lead Free: Lead Free; Supplier Part Number 1: 311-10.0KLRCT-ND
R67-R70 R79-R82 R87 R88 = RC0402FR-07330RL: RES SMD 330 OHM 1% 1/16W 0402; Manufacturer: Yageo; Power Rating: 62.5mW; Voltage Rating: 50V; Temperature Coefficient: 100ppm/°C; Max Power Dissipation: 63mW; ComponentLink1URL: http://www.farnell.com/datasheets/1784430.pdf?src-supplier=Element14; ComponentLink1Description: http://www.farnell.com/datasheets/1784430.pdf?src-supplier=Element14; ComponentLink2URL: http://www.yageo.com/documents/recent/PYu-RC_Group_51_RoHS_L_9.pdf?src-supplier=Mouser; ComponentLink2Description: http://www.yageo.com/documents/recent/PYu-RC_Group_51_RoHS_L_9.pdf?src-supplier=Mouser; ComponentLink3URL: http://www.yageo.com/documents/recent/PYu-RC0402_51_RoHS_L_6_r.pdf?src-supplier=Future+Electronics; ComponentLink3Description: http://www.yageo.com/documents/recent/PYu-RC0402_51_RoHS_L_6_r.pdf?src-supplier=Future+Electronics; ComponentLink4URL: https://www.verical.com/server-webapp/html/getDatasheet?partID=329466&src-supplier=Verical; ComponentLink4Description: https://www.verical.com/server-webapp/html/getDatasheet?partID=329466&src-supplier=Verical; ComponentLink5URL: http://www.farnell.com/datasheets/1018594.pdf?src-supplier=Element14; ComponentLink5Description: http://www.farnell.com/datasheets/1018594.pdf?src-supplier=Element14; ComponentLink6URL: http://www.farnell.com/datasheets/2167052.pdf?src-supplier=Element14; ComponentLink6Description: http://www.farnell.com/datasheets/2167052.pdf?src-supplier=Element14; ComponentLink7URL: http://documents.rs-components.com/techlib://itc_doclist_GB.htm?stockno=6185810&src-supplier=RSComponents; ComponentLink7Description: http://documents.rs-components.com/techlib://itc_doclist_GB.htm?stockno=6185810&src-supplier=RSComponents; Supplier 1: Digi-Key; Manufacturer Part Number: RC0402FR-07330RL; Stock 1: 6258760; Pricing 1: 1=0.1, 10=0.016, 100=0.0067, 1000=0.003, 2500=0.0026, 5000=0.0022 (USD); Case/Package: 0402; Case Code (Metric): 1005; Case Code (Imperial): 0402; Min Operating Temperature: -55°C; Max Operating Temperature: 155°C; Packaging: Tape and Reel; Resistance: 330R; Tolerance: 1%; Composition: Thick Film; Termination: SMD/SMT; Military Standard: Not; Package Quantity: 1; Number of Terminations: 2; Features: Moisture Resistant; Length: 0.039inch; Height: 0.016inch; Depth: 0.5mm; Width: 0.02inch; REACH SVHC: Unknown; Lead Free: Lead Free; ComponentLink8URL: http://www.yageo.com/documents/recent/PYu-RC_Group_51_RoHS_L_10.pdf?src-supplier=Digi-Key; ComponentLink8Description: http://www.yageo.com/documents/recent/PYu-RC_Group_51_RoHS_L_10.pdf?src-supplier=Digi-Key; ComponentLink9URL: http://www.mouser.com/ds/2/447/PYu-RC0402_51_RoHS_L_6_r-8721.pdf?src-supplier=Mouser; ComponentLink9Description: http://www.mouser.com/ds/2/447/PYu-RC0402_51_RoHS_L_6_r-8721.pdf?src-supplier=Mouser; Supplier Part Number 1: 311-330LRCT-ND
RP1-RP10 = AT0402FRE071KL: RES SMD 1K OHM 1% 1/16W 0402; Manufacturer: Yageo; Resistance: 1kR; Max Power Dissipation: 63mW; Temperature Coefficient: 50ppm/°C; Supplier 1: Digi-Key; Manufacturer Part Number: AT0402FRE071KL; RoHS: Yes; Category: Chip SMD Resistors; Stock 1: 559; Pricing 1: 1=0.14000, 10=0.11800, 100=0.04620, 1000=0.01935, 2500=0.01774, 5000=0.01612 (USD); Case/Package: 0402; Case Code (Metric): 1005; Case Code (Imperial): 0402; Min Operating Temperature: -55°C; Max Operating Temperature: 155°C; Packaging: Tape and Reel; Resistor Type: Thin Film; Number of Terminations: 2; Tolerance: 1%; Features: Moisture Resistant,Automotive AEC-Q200,Anti-Sulfur; Length: 0.039inch; Width: 0.02inch; Height: 0.014inch; RoHS Compliant: Yes; ComponentLink1URL: http://www.yageo.com/documents/recent/PYu-AT_51_RoHS_L-3.pdf?src-supplier=Digi-Key; ComponentLink1Description: http://www.yageo.com/documents/recent/PYu-AT_51_RoHS_L-3.pdf?src-supplier=Digi-Key; ComponentLink2URL: http://www.yageo.com/documents/recent/PYu-AT_51_RoHS_L_5.pdf?src-supplier=Digi-Key; ComponentLink2Description: http://www.yageo.com/documents/recent/PYu-AT_51_RoHS_L_5.pdf?src-supplier=Digi-Key; Supplier Part Number 1: YAG2105CT-ND